# Altium schematic sheet Controller-Sheet.SchDoc (part 1 of 2)
size 420 x 297 mm; SheetNumber: 1; SheetTotal: 2
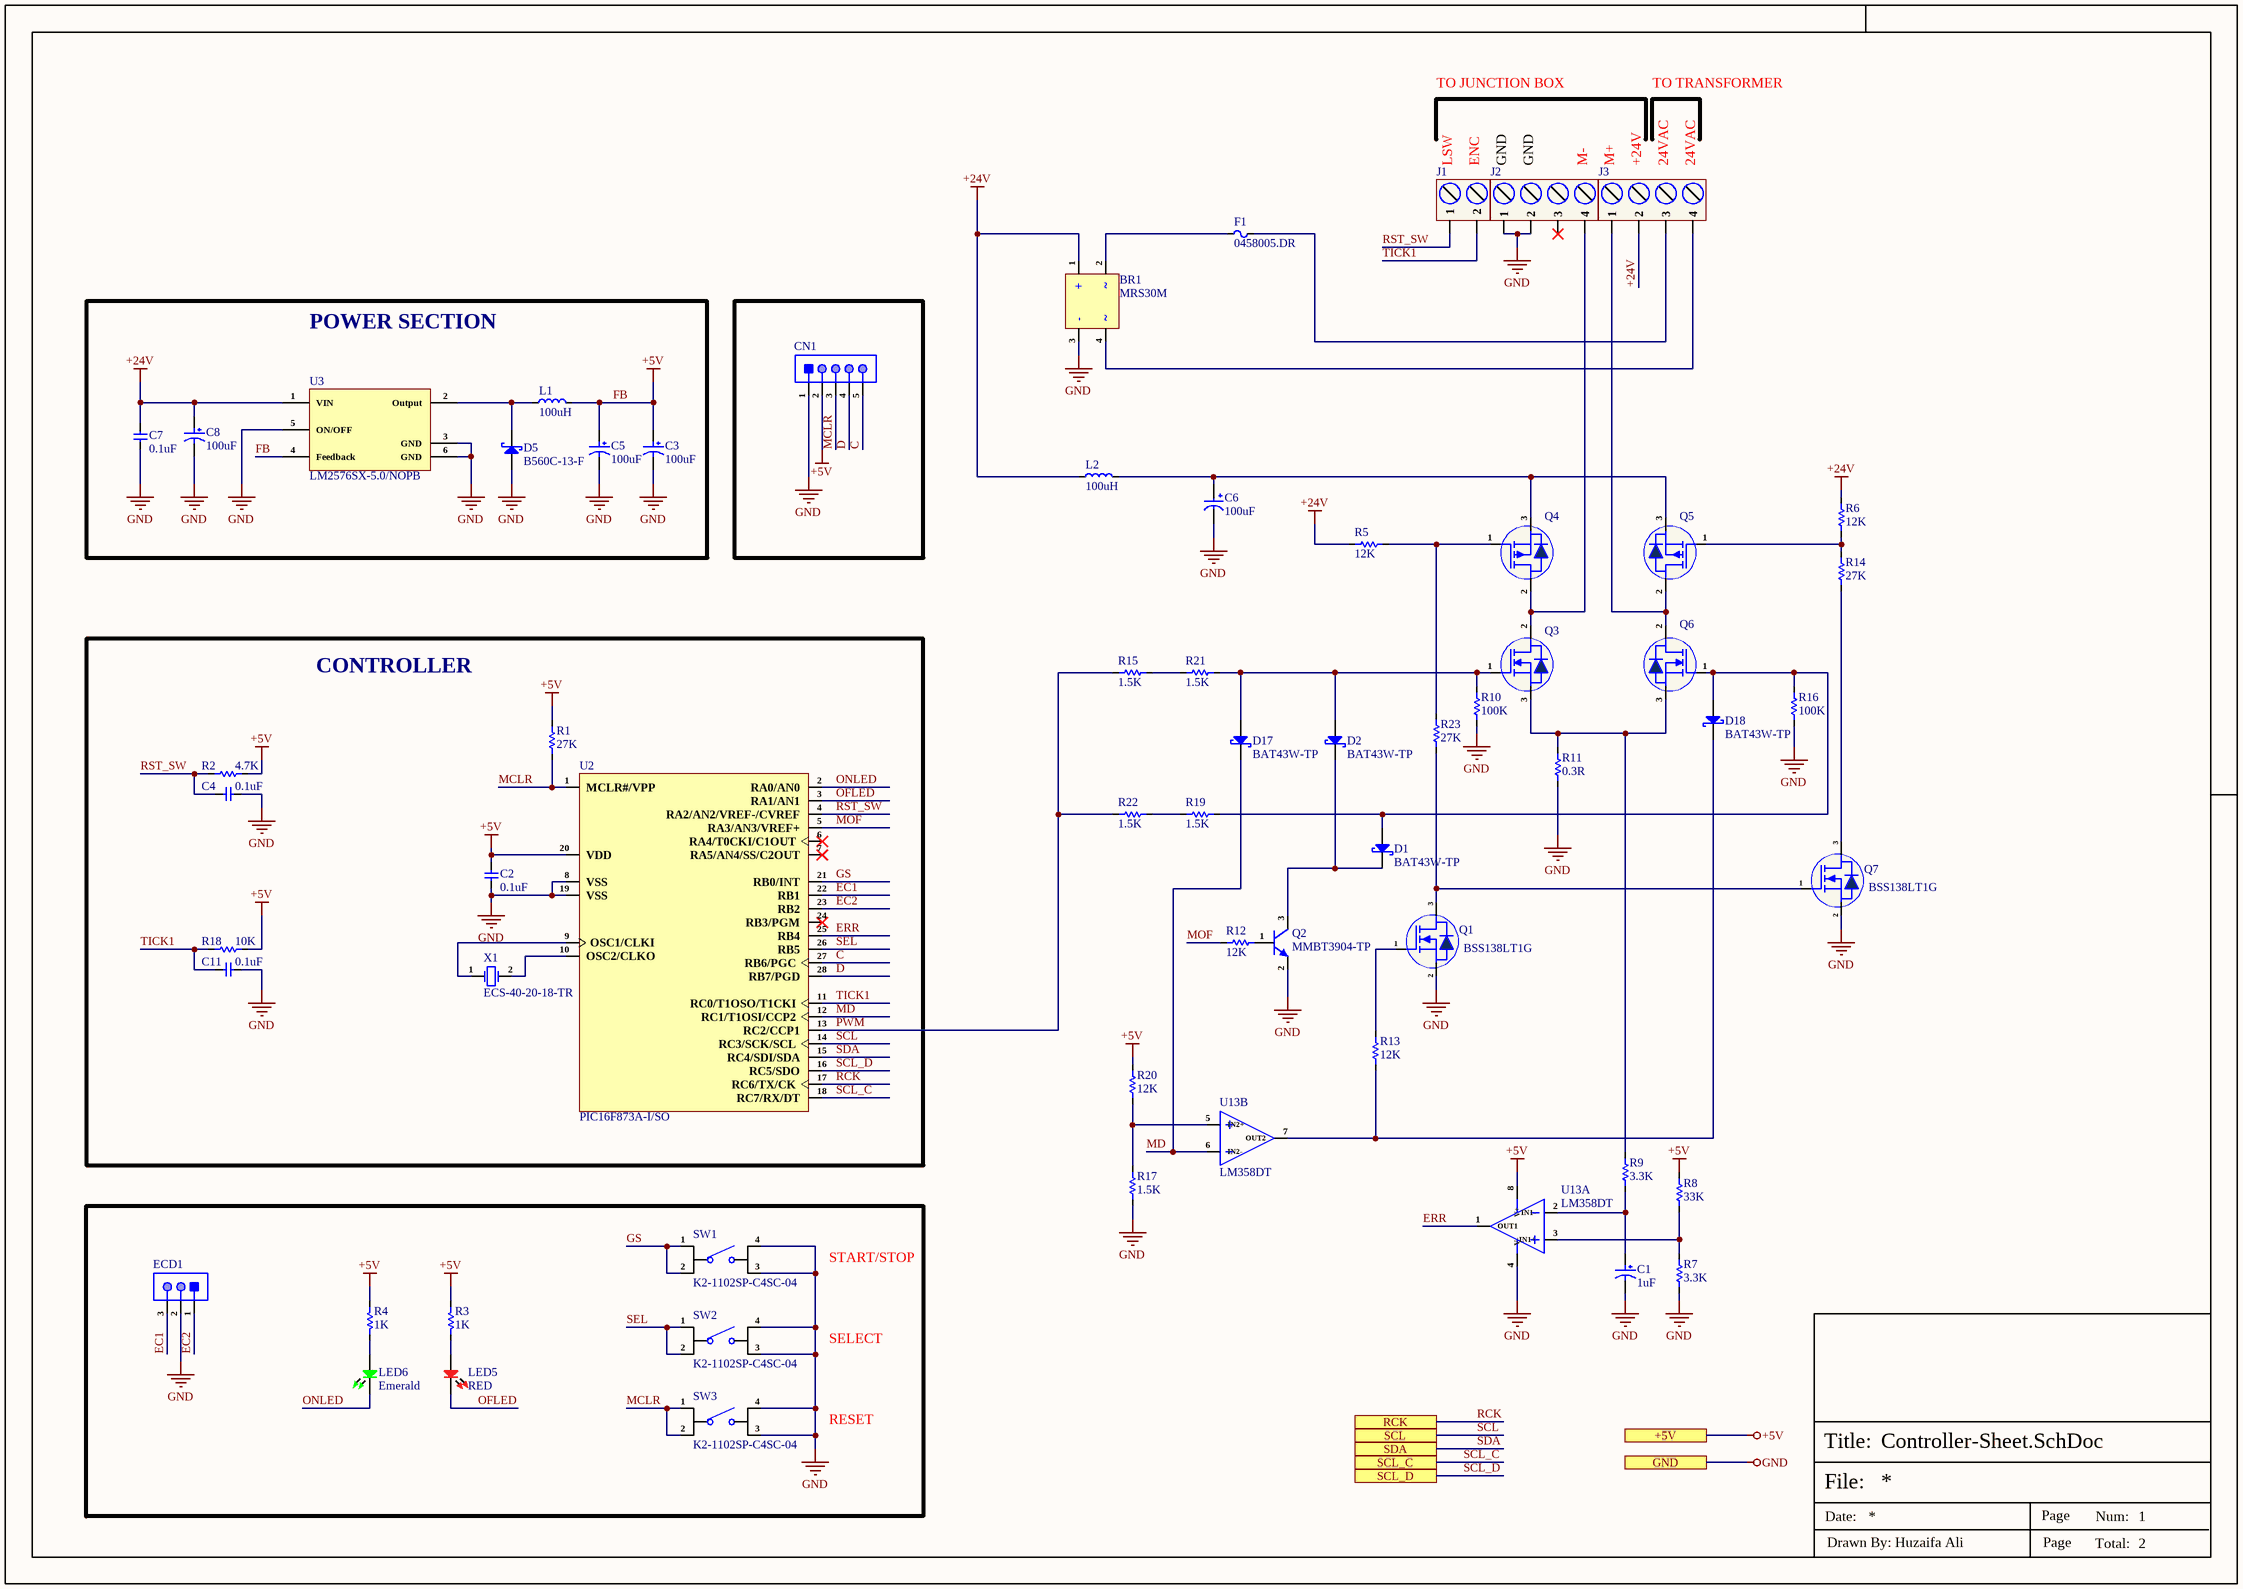
[diagram p0: Controller-Sheet.SchDoc]

## Parts
BR1  MRS30M  [MSBL]
C1  1uF  [865060640001]
C2  0.1uF  [Cap-0402]
C3  100uF  [RVT1H101M0607]
C4  0.1uF  [Cap-0402]
C5  100uF  [RVT1H101M0607]
C6  100uF  [UWT1H101MNL1GS_]
C7  0.1uF  [Cap-0402]
C8  100uF  [RVT1H101M0607]
C11  0.1uF  [Cap-0402]
CN1  B-2100S05P-A110  [HDR1X5_]  (value not drawn)
D1  BAT43W-TP  [SOD-123]
D2  BAT43W-TP  [SOD-123]
D5  B560C-13-F  [SMC]
D17  BAT43W-TP  [SOD-123]
D18  BAT43W-TP  [SOD-123]
ECD1  B-2100S03P-A110  [HDR1X3_]  (value not drawn)
F1  0458005.DR  [Fuse 1206 (3216 Metric)]
J1  1715721  [1715721]  (value not drawn)
J2  1715747  [1715747]  (value not drawn)
J3  1715747  [1715747]  (value not drawn)
L1  100uH  [SRP1770TA-101M]
L2  100uH  [1410454C]
LED5  RED  [LED-0603]
LED6  Emerald  [LED-0603]
Q1  BSS138LT1G  [SOT-23]
Q2  MMBT3904-TP  [SOT-23]
Q3  IRFR024NTRPBF  [DPAK]  (value not drawn)
Q4  IRFR5305TRLPBF  [DPAK]  (value not drawn)
Q5  IRFR5305TRLPBF  [DPAK]  (value not drawn)
Q6  IRFR024NTRPBF  [DPAK]  (value not drawn)
Q7  BSS138LT1G  [SOT-23]
R1  27K  [Res-0402]
R2  4.7K  [Res-0402]
R3  1K  [Res-0402]
R4  1K  [Res-0402]
R5  12K  [Res-0402]
R6  12K  [Res-0402]
R7  3.3K  [Res-0402]
R8  33K  [Res-0402]
R9  3.3K  [Res-0402]
R10  100K  [Res-0402]
R11  0.3R  [Res-0603]
R12  12K  [Res-0402]
R13  12K  [Res-0402]
R14  27K  [Res-0402]
R15  1.5K  [Res-0402]
R16  100K  [Res-0402]
R17  1.5K  [Res-0402]
R18  10K  [Res-0402]
R19  1.5K  [Res-0402]
R20  12K  [Res-0402]
R21  1.5K  [Res-0402]
R22  1.5K  [Res-0402]
R23  27K  [Res-0402]
SW1  K2-1102SP-C4SC-04  [K2-1102SP-C4SC-04]
SW2  K2-1102SP-C4SC-04  [K2-1102SP-C4SC-04]
SW3  K2-1102SP-C4SC-04  [K2-1102SP-C4SC-04]
U2  PIC16F873A-I/SO  [28-SOIC]
U3  LM2576SX-5.0/NOPB  [TO-263-5 (D2PAK)]
U13  LM358DT  [SOP-8]  (parts A,B of 2)
X1  ECS-40-20-18-TR  [ECS-40-20-18-TR]

## Blocks framed on the sheet
POWER SECTION: C3 C5 C7 C8 D5 L1 U3
CONTROLLER: C2 C4 C11 R1 R2 R18 U2 X1

## Ports
+5V (see 7-Segment-Sheet[4D]), GND (see 7-Segment-Sheet[4D]), RCK (see 7-Segment-Sheet[3D]), SCL (see 7-Segment-Sheet[3D]), SCL_C (see 7-Segment-Sheet[3D]), SCL_D (see 7-Segment-Sheet[3D]), SDA (see 7-Segment-Sheet[3D])

## Nets
+24V: BR1.1(+) C7.2 C8.1 J3.2 L2.1 R5.2 R6.2 U3.1(VIN)
FB: C2.2 C3.1 C5.1 CN1.2 L1.2 R1.2 R2.1 R3.1 R4.1 R8.2 R18.2 R20.2 U2.20(VDD) U3.4(Feedback) U13.8(V+) ; port +5V  [also labelled +5V]
GND: BR1.3(-) C1.2 C2.1 C3.2 C4.1 C5.2 C6.2 C7.1 C8.2 C11.1 CN1.1 D5.2(A) ECD1.2 J2.1 J2.2 Q1.2(S) Q2.2(E) Q7.2(S) R7.1 R10.1 R11.1 R16.1 R17.1 SW1.3 SW1.4 SW2.3 SW2.4 SW3.3 SW3.4 U2.8(VSS) U2.19(VSS) U3.3(GND) U3.5(ON/OFF) U3.6(GND) U13.4(V-) ; port GND
C: CN1.5 U2.27(RB6/PGC)
D: CN1.4 U2.28(RB7/PGD)
EC1: ECD1.3 U2.22(RB1)
EC2: ECD1.1 U2.23(RB2)
ERR: U2.25(RB4) U13.1(OUT1)
GS: SW1.1 SW1.2 U2.21(RB0/INT)
MCLR: CN1.3 R1.1 SW3.1 SW3.2 U2.1(MCLR#/VPP)
MD: D17.2(K) U2.12(RC1/T1OSI/CCP2) U13.6(IN2-)
MOF: R12.2 U2.5(RA3/AN3/VREF+)
OFLED: LED5.2 U2.3(RA1/AN1)
ONLED: LED6.2 U2.2(RA0/AN0)
PWM: R15.1 R22.1 U2.13(RC2/CCP1)
RCK: U2.17(RC6/TX/CK) ; port RCK
RST_SW: C4.2 J1.1 R2.2 U2.4(RA2/AN2/VREF-/CVREF)
SCL: U2.14(RC3/SCK/SCL) ; port SCL
SCL_C: U2.18(RC7/RX/DT) ; port SCL_C
SCL_D: U2.16(RC5/SDO) ; port SCL_D
SDA: U2.15(RC4/SDI/SDA) ; port SDA
SEL: SW2.1 SW2.2 U2.26(RB5)
TICK1: C11.2 J1.2 R18.1 U2.11(RC0/T1OSO/T1CKI)
NetBR1_2: BR1.2 F1.1
NetBR1_4: BR1.4 J3.4
NetC1_1: C1.1 R9.1 U13.2(IN1-)
NetC6_1: C6.1 L2.2 Q4.3(S) Q5.3(S)
NetD1_1: D1.1(A) D18.1(A) Q6.1(G) R16.2 R19.2
NetD1_2: D1.2(K) D2.2(K) Q2.3(C)
NetD2_1: D2.1(A) D17.1(A) Q3.1(G) R10.2 R21.2
NetD5_1: D5.1(K) L1.1 U3.2(Output)
NetD18_2: D18.2(K) R13.1 U13.7(OUT2)
NetF1_2: F1.2 J3.3
NetJ2_4: J2.4 Q3.2(D) Q4.2(D)
NetJ3_1: J3.1 Q5.2(D) Q6.2(D)
NetLED5_1: LED5.1 R3.2
NetLED6_1: LED6.1 R4.2
NetQ1_1: Q1.1(G) R13.2
NetQ1_3: Q1.3(D) Q7.1(G) R23.1
NetQ2_1: Q2.1(B) R12.1
NetQ3_3: Q3.3(S) Q6.3(S) R9.2 R11.2
NetQ4_1: Q4.1(G) R5.1 R23.2
NetQ5_1: Q5.1(G) R6.1 R14.2
NetQ7_3: Q7.3(D) R14.1
NetR7_2: R7.2 R8.1 U13.3(IN1+)
NetR15_2: R15.2 R21.1
NetR17_2: R17.2 R20.1 U13.5(IN2+)
NetR19_1: R19.1 R22.2
NetU2_9: U2.9(OSC1/CLKI) X1.1(OSC1)
NetU2_10: U2.10(OSC2/CLKO) X1.2(OSC2)

Not connected (* = marked no-connect by the designer): J2 3*; U2 6(RA4/T0CKI/C1OUT)* 7(RA5/AN4/SS/C2OUT)* 24(RB3/PGM)*

## Notes on the sheet
- TO JUNCTION BOX
- TO TRANSFORMER
- LSW
- ENC
- GND
- M-
- M+
- +24V
- 24VAC
- START/STOP
- SELECT
- RESET
- File:
- Title:
- Date:
- Page
- Num:
- Total:
- Drawn By: Huzaifa Ali